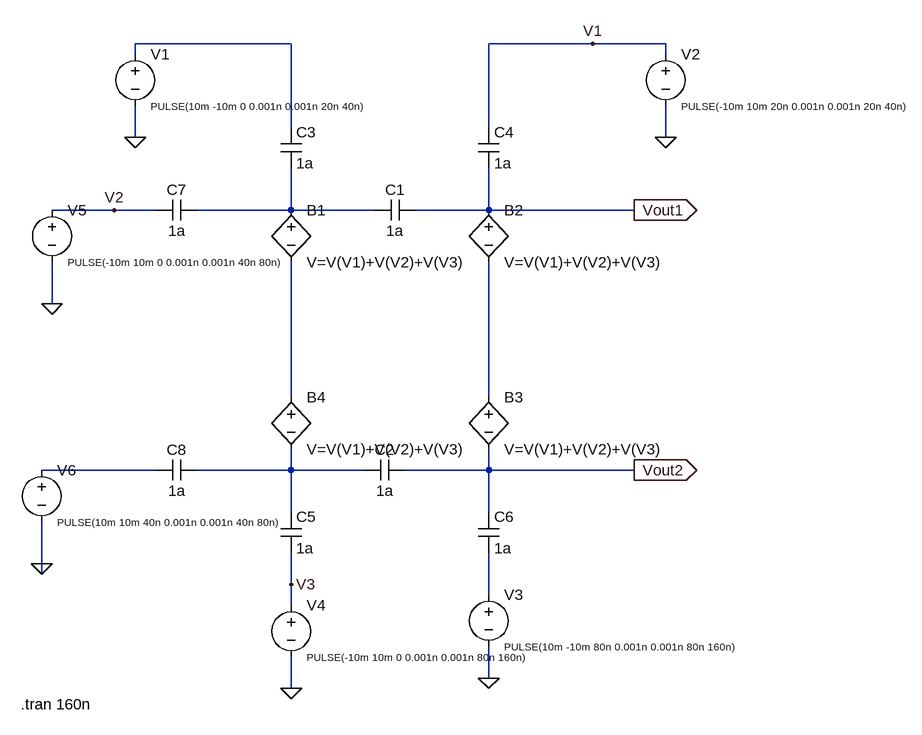
[diagram p0: schematic majority gate.asc]
majority gate.asc, the LTspice schematic file:
Version 4.1
SHEET 1 1032 964
WIRE -112 -96 -352 -96
WIRE 352 -96 192 -96
WIRE 464 -96 352 -96
WIRE -352 -80 -352 -96
WIRE 464 -80 464 -96
WIRE -112 32 -112 -96
WIRE 192 32 192 -96
WIRE -352 48 -352 0
WIRE 464 48 464 0
WIRE -384 160 -480 160
WIRE -320 160 -384 160
WIRE -112 160 -112 96
WIRE -112 160 -256 160
WIRE 16 160 -112 160
WIRE 192 160 192 96
WIRE 192 160 80 160
WIRE 416 160 192 160
WIRE -480 304 -480 240
WIRE -112 448 -112 240
WIRE 192 448 192 240
WIRE -320 560 -496 560
WIRE -112 560 -112 528
WIRE -112 560 -256 560
WIRE 0 560 -112 560
WIRE 192 560 192 528
WIRE 192 560 64 560
WIRE 416 560 192 560
WIRE -112 624 -112 560
WIRE 192 624 192 560
WIRE -496 704 -496 640
WIRE -496 720 -496 704
WIRE -112 736 -112 688
WIRE 192 752 192 688
WIRE -112 768 -112 736
WIRE 192 880 192 832
WIRE -112 896 -112 848
FLAG -480 304 0
FLAG -352 48 0
FLAG 464 48 0
FLAG 192 880 0
FLAG -112 896 0
FLAG -496 704 0
FLAG 416 160 Vout1
IOPIN 416 160 Out
FLAG 416 560 Vout2
IOPIN 416 560 Out
FLAG 352 -96 V1
FLAG -384 160 V2
FLAG -112 736 V3
SYMBOL bv -112 144 R0
SYMATTR InstName B1
SYMATTR Value V=V(V1)+V(V2)+V(V3)
SYMBOL bv 192 144 R0
SYMATTR InstName B2
SYMATTR Value V=V(V1)+V(V2)+V(V3)
SYMBOL bv -112 432 R0
SYMATTR InstName B4
SYMATTR Value V=V(V1)+V(V2)+V(V3)
SYMBOL cap 80 144 R90
WINDOW 0 0 32 VBottom 2
WINDOW 3 32 32 VTop 2
SYMATTR InstName C1
SYMATTR Value 1a
SYMBOL cap 64 544 R90
WINDOW 0 0 32 VBottom 2
WINDOW 3 32 32 VTop 2
SYMATTR InstName C2
SYMATTR Value 1a
SYMBOL bv 192 432 R0
SYMATTR InstName B3
SYMATTR Value V=V(V1)+V(V2)+V(V3)
SYMBOL cap -128 32 R0
SYMATTR InstName C3
SYMATTR Value 1a
SYMBOL cap 176 32 R0
SYMATTR InstName C4
SYMATTR Value 1a
SYMBOL cap -128 624 R0
SYMATTR InstName C5
SYMATTR Value 1a
SYMBOL cap 176 624 R0
SYMATTR InstName C6
SYMATTR Value 1a
SYMBOL cap -256 544 R90
WINDOW 0 0 32 VBottom 2
WINDOW 3 32 32 VTop 2
SYMATTR InstName C8
SYMATTR Value 1a
SYMBOL voltage -352 -96 R0
WINDOW 3 24 96 Left 1
WINDOW 123 0 0 Left 0
WINDOW 39 0 0 Left 0
SYMATTR InstName V1
SYMATTR Value PULSE(10m -10m 0 0.001n 0.001n 20n 40n)
SYMBOL voltage 464 -96 R0
WINDOW 3 24 96 Left 1
WINDOW 123 0 0 Left 0
WINDOW 39 0 0 Left 0
SYMATTR InstName V2
SYMATTR Value PULSE(-10m 10m 20n 0.001n 0.001n 20n 40n)
SYMBOL voltage 192 736 R0
WINDOW 3 24 96 Left 1
WINDOW 123 0 0 Left 0
WINDOW 39 0 0 Left 0
SYMATTR InstName V3
SYMATTR Value PULSE(10m -10m 80n 0.001n 0.001n 80n 160n)
SYMBOL voltage -112 752 R0
WINDOW 3 24 96 Left 1
WINDOW 123 0 0 Left 0
WINDOW 39 0 0 Left 0
SYMATTR InstName V4
SYMATTR Value PULSE(-10m 10m 0 0.001n 0.001n 80n 160n)
SYMBOL voltage -480 144 R0
WINDOW 3 24 96 Left 1
WINDOW 123 0 0 Left 0
WINDOW 39 0 0 Left 0
SYMATTR InstName V5
SYMATTR Value PULSE(-10m 10m 0 0.001n 0.001n 40n 80n)
SYMBOL voltage -496 544 R0
WINDOW 3 24 96 Left 1
WINDOW 123 0 0 Left 0
WINDOW 39 0 0 Left 0
SYMATTR InstName V6
SYMATTR Value PULSE(10m 10m 40n 0.001n 0.001n 40n 80n)
SYMBOL cap -256 144 R90
WINDOW 0 0 32 VBottom 2
WINDOW 3 32 32 VTop 2
SYMATTR InstName C7
SYMATTR Value 1a
TEXT -528 920 Left 2 !.tran 160n

The netlist it stands for:
* majority gate.asc
B1 N002 N003 V=V(V1)+V(V2)+V(V3)
B2 Vout1 N004 V=V(V1)+V(V2)+V(V3)
B4 N003 N006 V=V(V1)+V(V2)+V(V3)
C1 Vout1 N002 1a
C2 Vout2 N006 1a
B3 N004 Vout2 V=V(V1)+V(V2)+V(V3)
C3 N001 N002 1a
C4 V1 Vout1 1a
C5 N006 V3 1a
C6 Vout2 N007 1a
C8 N006 N005 1a
V1 N001 0 PULSE(10m -10m 0 0.001n 0.001n 20n 40n)
V2 V1 0 PULSE(-10m 10m 20n 0.001n 0.001n 20n 40n)
V3 N007 0 PULSE(10m -10m 80n 0.001n 0.001n 80n 160n)
V4 V3 0 PULSE(-10m 10m 0 0.001n 0.001n 80n 160n)
V5 V2 0 PULSE(-10m 10m 0 0.001n 0.001n 40n 80n)
V6 N005 0 PULSE(10m 10m 40n 0.001n 0.001n 40n 80n)
C7 N002 V2 1a
.tran 160n
.backanno
.end